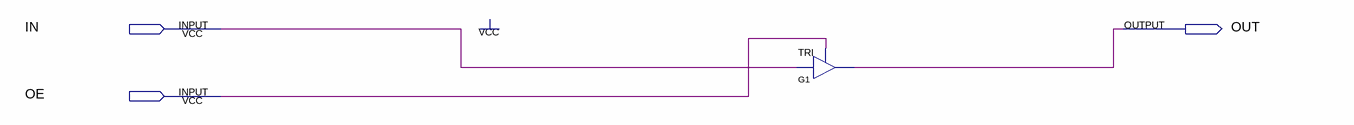
[diagram p0: schematic sheet]
// Quartus schematic probe_trioe.bdf as structural Verilog: 1 symbols, 3 pins
module probe_trioe (
  input  IN,
  input  OE,
  output OUT
);

  TRI G1 (.IN(IN), .OE(OE), .OUT(OUT));
endmodule
